# Altium schematic sheet 12_40_IMU.SchDoc
size 289 x 396 mm
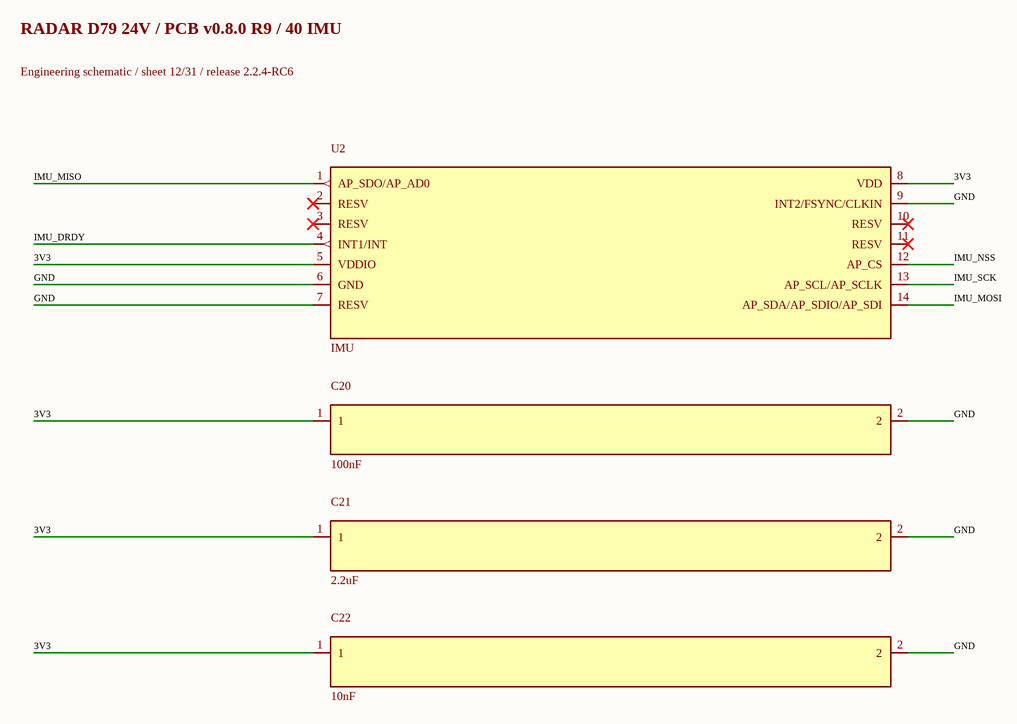
[diagram p0: 12_40_IMU.SchDoc]

## Parts
C20  100nF  [C_0402_1005Metric]
C21  2.2uF  [C_0603_1608Metric]
C22  10nF  [C_0402_1005Metric]
U2  IMU  [ICM-42688-P_LGA14_2.5x3mm_P0.5mm]

## Nets
3V3: C20.1 C21.1 C22.1 U2.5(VDDIO) U2.8(VDD)
GND: C20.2 C21.2 C22.2 U2.6(GND) U2.7(RESV) U2.9(INT2/FSYNC/CLKIN)
IMU_DRDY: U2.4(INT1/INT)
IMU_MISO: U2.1(AP_SDO/AP_AD0)
IMU_MOSI: U2.14(AP_SDA/AP_SDIO/AP_SDI)
IMU_NSS: U2.12(AP_CS)
IMU_SCK: U2.13(AP_SCL/AP_SCLK)

Not connected (* = marked no-connect by the designer): U2 2(RESV)* 3(RESV)* 10(RESV)* 11(RESV)*

## Notes on the sheet
- RADAR D79 24V / PCB v0.8.0 R9 / 40 IMU
- Engineering schematic / sheet 12/31 / release 2.2.4-RC6